# Altium schematic sheet Mux_Sheet_1.SchDoc
size A4; SheetNumber: 8
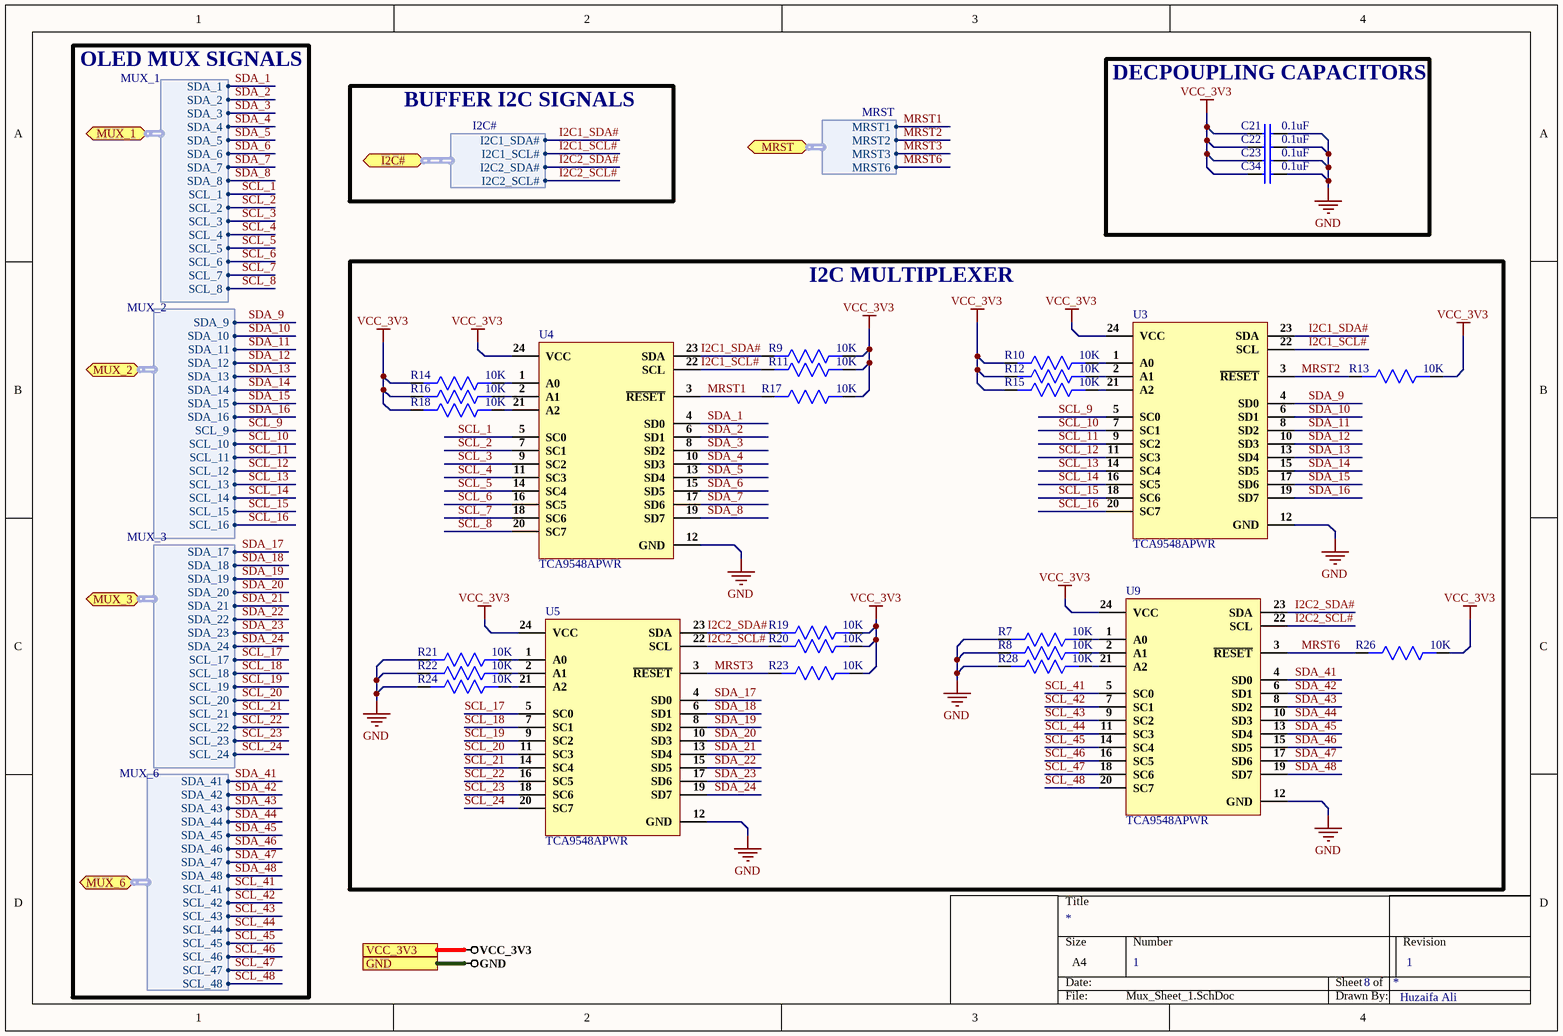
[diagram p0: Mux_Sheet_1.SchDoc]

## Parts
C21  0.1uF  [Cap0603]
C22  0.1uF  [Cap0603]
C23  0.1uF  [Cap0603]
C34  0.1uF  [Cap0603]
R7  10K  [Res0603]
R8  10K  [Res0603]
R9  10K  [Res0603]
R10  10K  [Res0603]
R11  10K  [Res0603]
R12  10K  [Res0603]
R13  10K  [Res0603]
R14  10K  [Res0603]
R15  10K  [Res0603]
R16  10K  [Res0603]
R17  10K  [Res0603]
R18  10K  [Res0603]
R19  10K  [Res0603]
R20  10K  [Res0603]
R21  10K  [Res0603]
R22  10K  [Res0603]
R23  10K  [Res0603]
R24  10K  [Res0603]
R26  10K  [Res0603]
R28  10K  [Res0603]
U3  TCA9548APWR  [24-TSSOP]
U4  TCA9548APWR  [24-TSSOP]
U5  TCA9548APWR  [24-TSSOP]
U9  TCA9548APWR  [24-TSSOP]

## Blocks framed on the sheet
DECPOUPLING CAPACITORS: C21-C23 C34
I2C MULTIPLEXER: R7-R24 R26 R28 U3-U5 U9

## Ports
GND, I2C# (bidir, harness I2C#), MRST (bidir, harness MRST), MUX_1 (bidir, harness MUX_1), MUX_2 (bidir, harness MUX_2), MUX_3 (bidir, harness MUX_3), MUX_6 (bidir, harness MUX_6), VCC_3V3

## Harnesses
MUX_1: SDA_1, SDA_2, SDA_3, SDA_4, SDA_5, SDA_6, SDA_7, SDA_8, SCL_1, SCL_2, SCL_3, SCL_4, SCL_5, SCL_6, SCL_7, SCL_8
MUX_2: SDA_9, SDA_10, SDA_11, SDA_12, SDA_13, SDA_14, SDA_15, SDA_16, SCL_9, SCL_10, SCL_11, SCL_12, SCL_13, SCL_14, SCL_15, SCL_16
MUX_3: SDA_17, SDA_18, SDA_19, SDA_20, SDA_21, SDA_22, SDA_23, SDA_24, SCL_17, SCL_18, SCL_19, SCL_20, SCL_21, SCL_22, SCL_23, SCL_24
I2C#: I2C1_SDA#, I2C1_SCL#, I2C2_SDA#, I2C2_SCL#
MRST: MRST1, MRST2, MRST3, MRST6
MUX_6: SDA_41, SDA_42, SDA_43, SDA_44, SDA_45, SDA_46, SDA_47, SDA_48, SCL_41, SCL_42, SCL_43, SCL_44, SCL_45, SCL_46, SCL_47, SCL_48

## Nets
GND: C21.2 C22.2 C23.2 C34.2 R7.2 R8.2 R21.2 R22.2 R24.2 R28.2 U3.12(GND) U4.12(GND) U5.12(GND) U9.12(GND) ; port GND
VCC_3V3: C21.1 C22.1 C23.1 C34.1 R9.1 R10.2 R11.1 R12.2 R13.1 R14.2 R15.2 R16.2 R17.1 R18.2 R19.1 R20.1 R23.1 R26.1 U3.24(VCC) U4.24(VCC) U5.24(VCC) U9.24(VCC) ; port VCC_3V3
I2C1_SCL#: R11.2 U3.22(SCL) U4.22(SCL) ; port I2C#.I2C1_SCL#
I2C1_SDA#: R9.2 U3.23(SDA) U4.23(SDA) ; port I2C#.I2C1_SDA#
I2C2_SCL#: R20.2 U5.22(SCL) U9.22(SCL) ; port I2C#.I2C2_SCL#
I2C2_SDA#: R19.2 U5.23(SDA) U9.23(SDA) ; port I2C#.I2C2_SDA#
MRST1: R17.2 U4.3(~{RESET}) ; port MRST.MRST1
MRST2: R13.2 U3.3(~{RESET}) ; port MRST.MRST2
MRST3: R23.2 U5.3(~{RESET}) ; port MRST.MRST3
MRST6: R26.2 U9.3(~{RESET}) ; port MRST.MRST6
SCL_1: U4.5(SC0) ; port MUX_1.SCL_1
SCL_2: U4.7(SC1) ; port MUX_1.SCL_2
SCL_3: U4.9(SC2) ; port MUX_1.SCL_3
SCL_4: U4.11(SC3) ; port MUX_1.SCL_4
SCL_5: U4.14(SC4) ; port MUX_1.SCL_5
SCL_6: U4.16(SC5) ; port MUX_1.SCL_6
SCL_7: U4.18(SC6) ; port MUX_1.SCL_7
SCL_8: U4.20(SC7) ; port MUX_1.SCL_8
SCL_9: U3.5(SC0) ; port MUX_2.SCL_9
SCL_10: U3.7(SC1) ; port MUX_2.SCL_10
SCL_11: U3.9(SC2) ; port MUX_2.SCL_11
SCL_12: U3.11(SC3) ; port MUX_2.SCL_12
SCL_13: U3.14(SC4) ; port MUX_2.SCL_13
SCL_14: U3.16(SC5) ; port MUX_2.SCL_14
SCL_15: U3.18(SC6) ; port MUX_2.SCL_15
SCL_16: U3.20(SC7) ; port MUX_2.SCL_16
SCL_17: U5.5(SC0) ; port MUX_3.SCL_17
SCL_18: U5.7(SC1) ; port MUX_3.SCL_18
SCL_19: U5.9(SC2) ; port MUX_3.SCL_19
SCL_20: U5.11(SC3) ; port MUX_3.SCL_20
SCL_21: U5.14(SC4) ; port MUX_3.SCL_21
SCL_22: U5.16(SC5) ; port MUX_3.SCL_22
SCL_23: U5.18(SC6) ; port MUX_3.SCL_23
SCL_24: U5.20(SC7) ; port MUX_3.SCL_24
SCL_41: U9.5(SC0) ; port MUX_6.SCL_41
SCL_42: U9.7(SC1) ; port MUX_6.SCL_42
SCL_43: U9.9(SC2) ; port MUX_6.SCL_43
SCL_44: U9.11(SC3) ; port MUX_6.SCL_44
SCL_45: U9.14(SC4) ; port MUX_6.SCL_45
SCL_46: U9.16(SC5) ; port MUX_6.SCL_46
SCL_47: U9.18(SC6) ; port MUX_6.SCL_47
SCL_48: U9.20(SC7) ; port MUX_6.SCL_48
SDA_1: U4.4(SD0) ; port MUX_1.SDA_1
SDA_2: U4.6(SD1) ; port MUX_1.SDA_2
SDA_3: U4.8(SD2) ; port MUX_1.SDA_3
SDA_4: U4.10(SD3) ; port MUX_1.SDA_4
SDA_5: U4.13(SD4) ; port MUX_1.SDA_5
SDA_6: U4.15(SD5) ; port MUX_1.SDA_6
SDA_7: U4.17(SD6) ; port MUX_1.SDA_7
SDA_8: U4.19(SD7) ; port MUX_1.SDA_8
SDA_9: U3.4(SD0) ; port MUX_2.SDA_9
SDA_10: U3.6(SD1) ; port MUX_2.SDA_10
SDA_11: U3.8(SD2) ; port MUX_2.SDA_11
SDA_12: U3.10(SD3) ; port MUX_2.SDA_12
SDA_13: U3.13(SD4) ; port MUX_2.SDA_13
SDA_14: U3.15(SD5) ; port MUX_2.SDA_14
SDA_15: U3.17(SD6) ; port MUX_2.SDA_15
SDA_16: U3.19(SD7) ; port MUX_2.SDA_16
SDA_17: U5.4(SD0) ; port MUX_3.SDA_17
SDA_18: U5.6(SD1) ; port MUX_3.SDA_18
SDA_19: U5.8(SD2) ; port MUX_3.SDA_19
SDA_20: U5.10(SD3) ; port MUX_3.SDA_20
SDA_21: U5.13(SD4) ; port MUX_3.SDA_21
SDA_22: U5.15(SD5) ; port MUX_3.SDA_22
SDA_23: U5.17(SD6) ; port MUX_3.SDA_23
SDA_24: U5.19(SD7) ; port MUX_3.SDA_24
SDA_41: U9.4(SD0) ; port MUX_6.SDA_41
SDA_42: U9.6(SD1) ; port MUX_6.SDA_42
SDA_43: U9.8(SD2) ; port MUX_6.SDA_43
SDA_44: U9.10(SD3) ; port MUX_6.SDA_44
SDA_45: U9.13(SD4) ; port MUX_6.SDA_45
SDA_46: U9.15(SD5) ; port MUX_6.SDA_46
SDA_47: U9.17(SD6) ; port MUX_6.SDA_47
SDA_48: U9.19(SD7) ; port MUX_6.SDA_48
NetR7_1: R7.1 U9.1(A0)
NetR8_1: R8.1 U9.2(A1)
NetR10_1: R10.1 U3.1(A0)
NetR12_1: R12.1 U3.2(A1)
NetR14_1: R14.1 U4.1(A0)
NetR15_1: R15.1 U3.21(A2)
NetR16_1: R16.1 U4.2(A1)
NetR18_1: R18.1 U4.21(A2)
NetR21_1: R21.1 U5.1(A0)
NetR22_1: R22.1 U5.2(A1)
NetR24_1: R24.1 U5.21(A2)
NetR28_1: R28.1 U9.21(A2)

## Notes on the sheet
- OLED MUX SIGNALS
- BUFFER I2C SIGNALS
- 1
- Huzaifa Ali

## Library data of the parts
C21-C23 C34 = CC0603ZRY5V9BB104: CAP CER 0.1UF 50V Y5V 0603; Manufacturer: Yageo; Capacitance: 100nF; Tolerance: 80%; Supplier 1: Digi-Key; Manufacturer Part Number: CC0603ZRY5V9BB104; Stock 1: 15000880; Pricing 1: 1=0.1, 10=0.075, 100=0.0334, 500=0.02386, 1000=0.01874 (USD); Mount: Surface Mount; Case/Package: 0603; Number of Pins: 2; Case Code (Metric): 1608; Case Code (Imperial): 0603; Min Operating Temperature: -30°C; Max Operating Temperature: 85°C; Dielectric: Y5V; Voltage Rating: 50V; Package Quantity: 1; Packaging: Tape and Reel; Voltage Rating (DC): 50V; Termination: SMD/SMT; Composition: Ceramic; Voltage: 50V; Length: 1.6mm; Height: 0.8mm; Width: 0.031inch; Thickness: 0.035inch; Depth: 0.8mm; Radiation Hardening: No; REACH SVHC: No SVHC; Lead Free: Lead Free; Halogen Free: Halogen Free; ComponentLink1URL: http://www.yageo.com/documents/recent/UPY-GPHC_Y5V_6.3V-to-50V_8.pdf?src-supplier=Digi-Key; ComponentLink1Description: http://www.yageo.com/documents/recent/UPY-GPHC_Y5V_6.3V-to-50V_8.pdf?src-supplier=Digi-Key; ComponentLink2URL: http://www.yageo.com/documents/recent/UPY-GPHC_Y5V_6.3V-to-50V_5.pdf?src-supplier=Avnet+Europe; ComponentLink2Description: http://www.yageo.com/documents/recent/UPY-GPHC_Y5V_6.3V-to-50V_5.pdf?src-supplier=Avnet+Europe; ComponentLink3URL: https://www.verical.com/server-webapp/html/getDatasheet?partID=403611&src-supplier=Verical; ComponentLink3Description: https://www.verical.com/server-webapp/html/getDatasheet?partID=403611&src-supplier=Verical; ComponentLink4URL: http://www.mouser.com/ds/2/447/Yageo_UPY-GP_NP0_16V-to-50V_9-358835.pdf?src-supplier=Mouser; ComponentLink4Description: http://www.mouser.com/ds/2/447/Yageo_UPY-GP_NP0_16V-to-50V_9-358835.pdf?src-supplier=Mouser; ComponentLink5URL: http://www.farnell.com/datasheets/1132289.pdf?src-supplier=Element14; ComponentLink5Description: http://www.farnell.com/datasheets/1132289.pdf?src-supplier=Element14; Supplier Part Number 1: 311-1343-1-ND
R7-R24 R26 R28 = AC0603JR-0710KL: RES SMD 10K OHM 5% 1/10W 0603; Manufacturer: Yageo; Voltage Rating: 50V; Resistance: 10kR; Power Rating: 100mW; Temperature Coefficient: 100ppm/°C; Supplier 1: Future Electronics; Manufacturer Part Number: AC0603JR-0710KL; RoHS: Yes; Category: Chip SMD Resistors; Stock 1: 1533000; Pricing 1: 5000=0.00540 (USD); Case/Package: 0603; Case Code (Imperial): 0603; Case Code (Metric): 1608; Size Code: 0603; Min Operating Temperature: -55°C; Max Operating Temperature: 155°C; Packaging: Tape and Reel; Tolerance: 5%; Package Quantity: 1; Resistor Type: Thick Film; Termination: SMD/SMT; Number of Terminations: 2; Max Power Dissipation: 100mW; Features: Moisture Resistant,Automotive AEC-Q200,Anti-Sulfur; Series: AC; Construction: Rectangular; Length: 0.063inch; Width: 0.031inch; Height: 0.022inch; Depth: 0.8mm; Military Standard: Not; Lead Free: Lead Free; RoHS Compliant: Yes; ComponentLink1URL: https://datasheet.ciiva.com/5562/pyu-ac-51-rohs-l-2-5562553.pdf?src-supplier=Mouser; ComponentLink1Description: https://datasheet.ciiva.com/5562/pyu-ac-51-rohs-l-2-5562553.pdf?src-supplier=Mouser; Supplier Part Number 1: 1029044
U3-U5 U9 = TCA9548APWR: IC BUS SWITCH 1 X 8:1 24TSSOP; Manufacturer: Texas Instruments; Max Supply Voltage: 5.5V; Min Supply Voltage: 1.65V; On-State Resistance: 70R; Max Supply Current: 80uA; Supply Type: Single; Independent Circuits: 1; Supplier 1: Digi-Key; Manufacturer Part Number: TCA9548APWR; RoHS: Yes; Category: Decoders and Multiplexers; Pricing 1: 1=2.09000, 10=1.87600, 25=1.77040, 100=1.50820, 250=1.41616, 500=1.23914, 1000=1.16900 (USD); Mount: Surface Mount; Case/Package: TSSOP; Number of Pins: 24; Contact Plating: Gold; Min Operating Temperature: -40°C; Max Operating Temperature: 85°C; Packaging: Tape and Reel; Package Quantity: 1; REACH SVHC: No SVHC; Lead Free: Lead Free; ComponentLink1URL: https://datasheet.ciiva.com/6614/tca9548a-6614721.pdf?src-supplier=Digi-Key; ComponentLink1Description: https://datasheet.ciiva.com/6614/tca9548a-6614721.pdf?src-supplier=Digi-Key; Supplier Part Number 1: 296-34905-1-ND